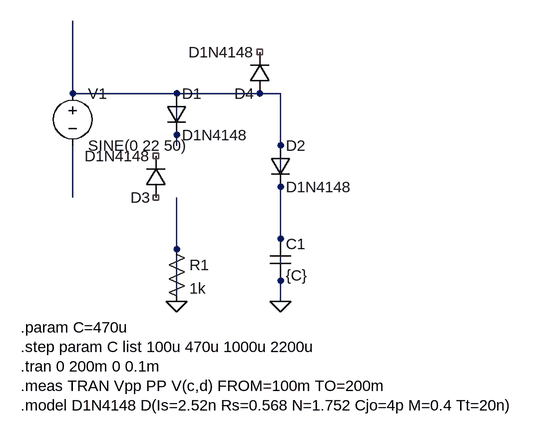
[diagram p0: schematic Ex12.asc]
Ex12.asc, the LTspice schematic file:
Version 4
SHEET 1 1680 1080
WIRE 160 80 160 48
WIRE 160 160 160 80
WIRE 320 160 160 160
WIRE 480 160 320 160
WIRE 320 240 320 160
WIRE 480 240 480 160
WIRE 160 320 160 240
WIRE 480 320 480 240
WIRE 320 400 320 320
WIRE 480 400 480 320
WIRE 320 480 320 400
WIRE 480 480 480 400
FLAG 320 480 0
FLAG 480 480 0
SYMBOL voltage 160 144 R0
WINDOW 123 24 44 Left 2
WINDOW 39 0 0 Left 0
SYMATTR InstName V1
SYMATTR Value SINE(0 22 50)
SYMBOL diode 304 160 R0
SYMATTR InstName D1
SYMATTR Value D1N4148
SYMBOL diode 304 320 R180
SYMATTR InstName D3
SYMATTR Value D1N4148
SYMBOL diode 464 240 R0
SYMATTR InstName D2
SYMATTR Value D1N4148
SYMBOL diode 464 160 R180
SYMATTR InstName D4
SYMATTR Value D1N4148
SYMBOL res 304 384 R0
SYMATTR InstName R1
SYMATTR Value 1k
SYMBOL cap 464 384 R0
SYMATTR InstName C1
SYMATTR Value {C}
NET 320 160 p
NET 480 160 c
NET 320 320 d
TEXT 80 520 Left 2 !.param C=470u
TEXT 80 550 Left 2 !.step param C list 100u 470u 1000u 2200u
TEXT 80 580 Left 2 !.tran 0 200m 0 0.1m
TEXT 80 610 Left 2 !.meas TRAN Vpp PP V(c,d) FROM=100m TO=200m
TEXT 80 640 Left 2 !.model D1N4148 D(Is=2.52n Rs=0.568 N=1.752 Cjo=4p M=0.4 Tt=20n)

The netlist it stands for:
* Ex12.asc
V1 0 N001 SINE(0 22 50)
D1 0 0 D1N4148
D3 NC_01 NC_02 D1N4148
D2 0 0 D1N4148
D4 0 NC_03 D1N4148
R1 0 0 1k
C1 0 0 {C}
.model D D
.lib standard.dio
.param C=470u
.step param C list 100u 470u 1000u 2200u
.tran 0 200m 0 0.1m
.meas TRAN Vpp PP V(c,d) FROM=100m TO=200m
.model D1N4148 D(Is=2.52n Rs=0.568 N=1.752 Cjo=4p M=0.4 Tt=20n)
.backanno
.end